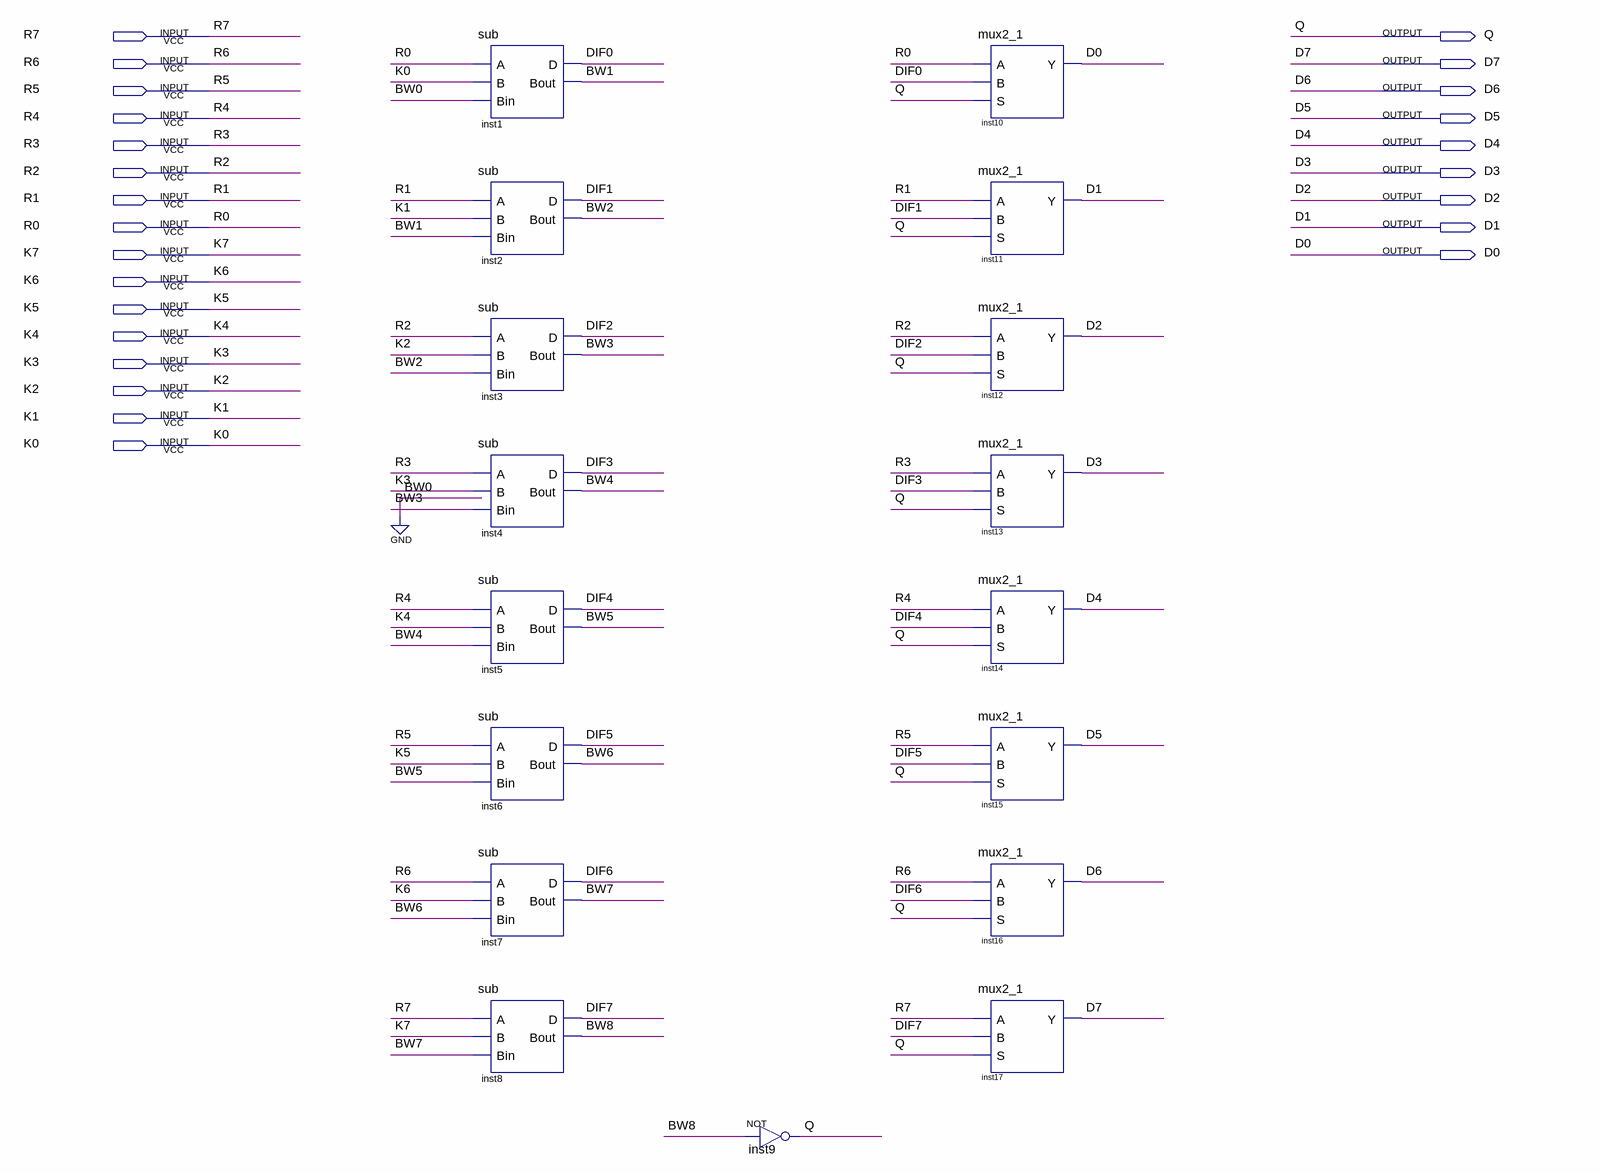
[diagram p0: schematic sheet]
// Quartus schematic cmp_sub8.bdf as structural Verilog: 17 symbols, 25 pins
module cmp_sub8 (
  input  R7,
  input  R6,
  input  R5,
  input  R4,
  input  R3,
  input  R2,
  input  R1,
  input  R0,
  input  K7,
  input  K6,
  input  K5,
  input  K4,
  input  K3,
  input  K2,
  input  K1,
  input  K0,
  output Q,
  output D7,
  output D6,
  output D5,
  output D4,
  output D3,
  output D2,
  output D1,
  output D0
);

  wire BW1, BW2, BW3, BW4, BW5, BW6, BW7, BW8, DIF0, DIF1, DIF2, DIF3, DIF4, DIF5, DIF6, DIF7;

  sub inst1 (.A(R0), .B(K0), .Bin(1'b0), .D(DIF0), .Bout(BW1));
  sub inst2 (.A(R1), .B(K1), .Bin(BW1), .D(DIF1), .Bout(BW2));
  sub inst3 (.A(R2), .B(K2), .Bin(BW2), .D(DIF2), .Bout(BW3));
  sub inst4 (.A(R3), .B(K3), .Bin(BW3), .D(DIF3), .Bout(BW4));
  sub inst5 (.A(R4), .B(K4), .Bin(BW4), .D(DIF4), .Bout(BW5));
  sub inst6 (.A(R5), .B(K5), .Bin(BW5), .D(DIF5), .Bout(BW6));
  sub inst7 (.A(R6), .B(K6), .Bin(BW6), .D(DIF6), .Bout(BW7));
  sub inst8 (.A(R7), .B(K7), .Bin(BW7), .D(DIF7), .Bout(BW8));
  not inst9 (Q, BW8);
  mux2_1 inst10 (.A(R0), .B(DIF0), .S(Q), .Y(D0));
  mux2_1 inst11 (.A(R1), .B(DIF1), .S(Q), .Y(D1));
  mux2_1 inst12 (.A(R2), .B(DIF2), .S(Q), .Y(D2));
  mux2_1 inst13 (.A(R3), .B(DIF3), .S(Q), .Y(D3));
  mux2_1 inst14 (.A(R4), .B(DIF4), .S(Q), .Y(D4));
  mux2_1 inst15 (.A(R5), .B(DIF5), .S(Q), .Y(D5));
  mux2_1 inst16 (.A(R6), .B(DIF6), .S(Q), .Y(D6));
  mux2_1 inst17 (.A(R7), .B(DIF7), .S(Q), .Y(D7));
endmodule
